# Altium project Palm_V2.2.PrjPcb (part 3 of 3)

## Sheet Motor_Sheet.SchDoc
size B; DocumentNumber: 4; SheetNumber: 4; SheetTotal: 7
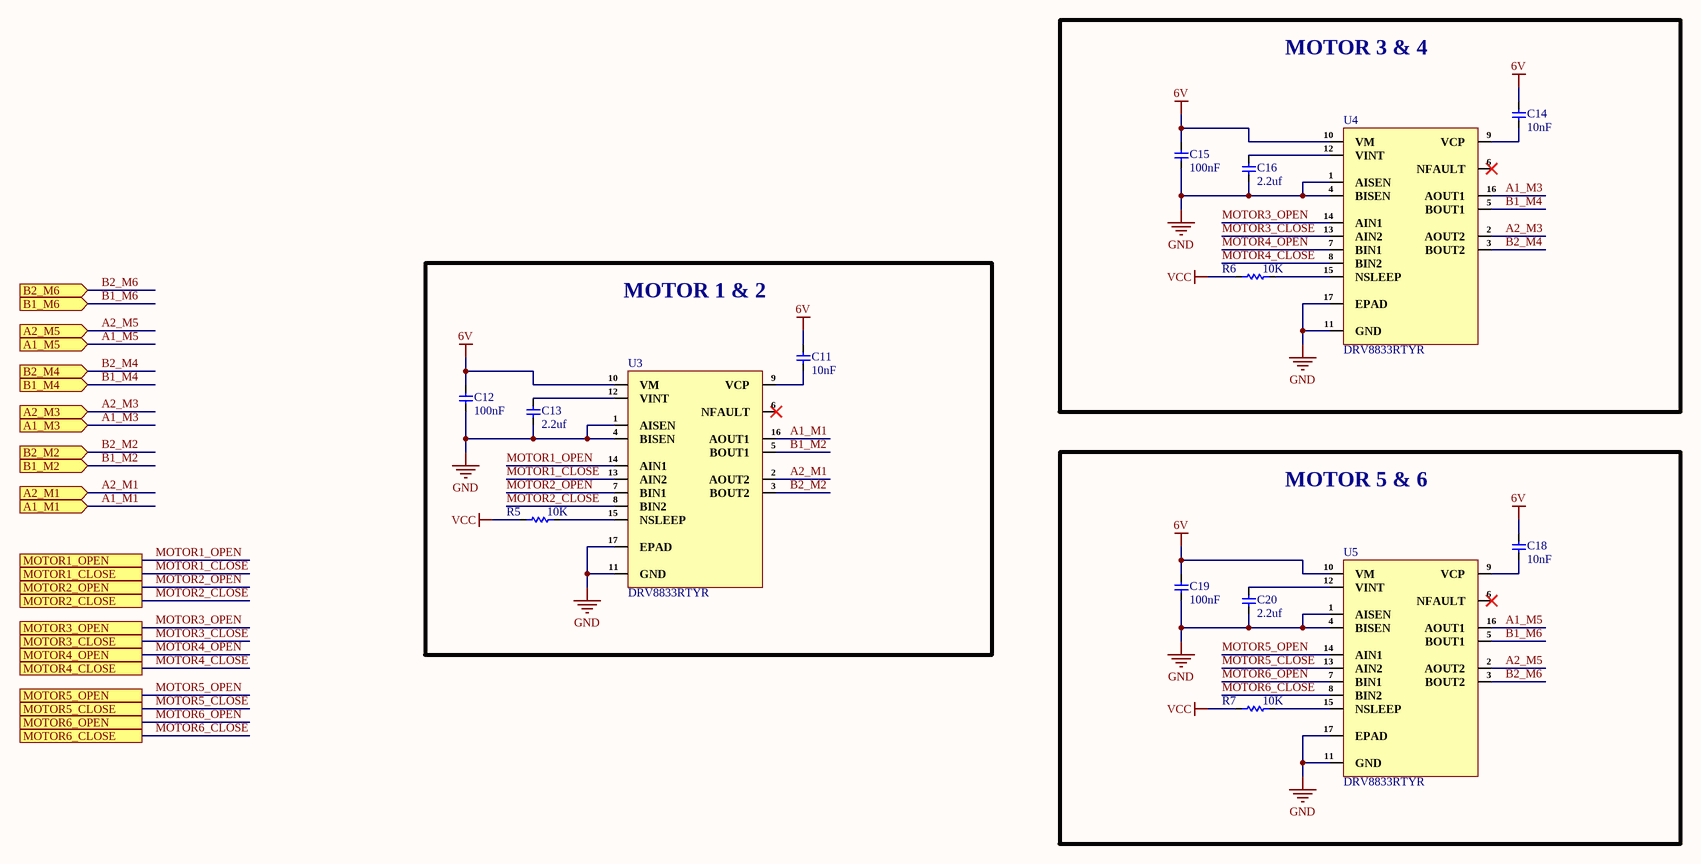
[diagram p5: Motor_Sheet.SchDoc]

### Parts
C11  10nF  [Cap-0402]
C12  100nF  [Cap-0402]
C13  2.2uf  [Cap-0402]
C14  10nF  [Cap-0402]
C15  100nF  [Cap-0402]
C16  2.2uf  [Cap-0402]
C18  10nF  [Cap-0402]
C19  100nF  [Cap-0402]
C20  2.2uf  [Cap-0402]
R5  10K  [Res-0402]
R6  10K  [Res-0402]
R7  10K  [Res-0402]
U3  DRV8833RTYR  [QFN-16-EP(4x4)]
U4  DRV8833RTYR  [QFN-16-EP(4x4)]
U5  DRV8833RTYR  [QFN-16-EP(4x4)]

### Blocks framed on the sheet
MOTOR 3 & 4: C14-C16 R6 U4
MOTOR 1 & 2: C11-C13 R5 U3
MOTOR 5 & 6: C18-C20 R7 U5

### Ports
A1_M1 (in), A1_M3 (in), A1_M5 (in), A2_M1 (in), A2_M3 (in), A2_M5 (in), B1_M2 (in), B1_M4 (in), B1_M6 (in), B2_M2 (in), B2_M4 (in), B2_M6 (in), MOTOR1_CLOSE, MOTOR1_OPEN, MOTOR2_CLOSE, MOTOR2_OPEN, MOTOR3_CLOSE, MOTOR3_OPEN, MOTOR4_CLOSE, MOTOR4_OPEN, MOTOR5_CLOSE, MOTOR5_OPEN, MOTOR6_CLOSE, MOTOR6_OPEN

### Nets
6V: C11.2 C12.2 C14.2 C15.2 C18.2 C19.2 U3.10(VM) U4.10(VM) U5.10(VM)
GND: C12.1 C13.1 C15.1 C16.1 C19.1 C20.1 U3.1(AISEN) U3.4(BISEN) U3.11(GND) U3.17(EPAD) U4.1(AISEN) U4.4(BISEN) U4.11(GND) U4.17(EPAD) U5.1(AISEN) U5.4(BISEN) U5.11(GND) U5.17(EPAD)
VCC: R5.1 R6.1 R7.1
A1_M1: U3.16(AOUT1) ; port A1_M1
A1_M3: U4.16(AOUT1) ; port A1_M3
A1_M5: U5.16(AOUT1) ; port A1_M5
A2_M1: U3.2(AOUT2) ; port A2_M1
A2_M3: U4.2(AOUT2) ; port A2_M3
A2_M5: U5.2(AOUT2) ; port A2_M5
B1_M2: U3.5(BOUT1) ; port B1_M2
B1_M4: U4.5(BOUT1) ; port B1_M4
B1_M6: U5.5(BOUT1) ; port B1_M6
B2_M2: U3.3(BOUT2) ; port B2_M2
B2_M4: U4.3(BOUT2) ; port B2_M4
B2_M6: U5.3(BOUT2) ; port B2_M6
MOTOR1_CLOSE: U3.13(AIN2) ; port MOTOR1_CLOSE
MOTOR1_OPEN: U3.14(AIN1) ; port MOTOR1_OPEN
MOTOR2_CLOSE: U3.8(BIN2) ; port MOTOR2_CLOSE
MOTOR2_OPEN: U3.7(BIN1) ; port MOTOR2_OPEN
MOTOR3_CLOSE: U4.13(AIN2) ; port MOTOR3_CLOSE
MOTOR3_OPEN: U4.14(AIN1) ; port MOTOR3_OPEN
MOTOR4_CLOSE: U4.8(BIN2) ; port MOTOR4_CLOSE
MOTOR4_OPEN: U4.7(BIN1) ; port MOTOR4_OPEN
MOTOR5_CLOSE: U5.13(AIN2) ; port MOTOR5_CLOSE
MOTOR5_OPEN: U5.14(AIN1) ; port MOTOR5_OPEN
MOTOR6_CLOSE: U5.8(BIN2) ; port MOTOR6_CLOSE
MOTOR6_OPEN: U5.7(BIN1) ; port MOTOR6_OPEN
NetC11_1: C11.1 U3.9(VCP)
NetC13_2: C13.2 U3.12(VINT)
NetC14_1: C14.1 U4.9(VCP)
NetC16_2: C16.2 U4.12(VINT)
NetC18_1: C18.1 U5.9(VCP)
NetC20_2: C20.2 U5.12(VINT)
NetR5_2: R5.2 U3.15(NSLEEP)
NetR6_2: R6.2 U4.15(NSLEEP)
NetR7_2: R7.2 U5.15(NSLEEP)

Not connected (* = marked no-connect by the designer): U3 6(NFAULT)*; U4 6(NFAULT)*; U5 6(NFAULT)*

### Library data of the parts
C11 C14 C18 = CC0402KRX7R9BB103: CAP CER 10000PF 50V X7R 0402; Manufacturer: Yageo; Tolerance: 10%; Item Type: Capacitor; Supplier 1: Avnet; Manufacturer Part Number: CC0402KRX7R9BB103; RoHS: Yes; Category: Ceramic Capacitors; Stock 1: 995000; Pricing 1: 10000=0.00178 (USD); Mount: Surface Mount; Case/Package: 0402; Case Code (Imperial): 0402; Case Code (Metric): 1005; Min Operating Temperature: -55°C; Max Operating Temperature: 125°C; Capacitance: 10nF; Dielectric: X7R; Packaging: Tape and Reel; Voltage Rating: 50V; Voltage Rating (DC): 50V; Package Quantity: 1; Termination: SMD/SMT; Resistor Type: Ceramic; Voltage: 50V; Series: CC; Length: 1mm; Width: 0.02inch; Height: 0.5mm; Thickness: 0.022inch; Depth: 0.5mm; Radiation Hardening: No; RoHS Compliant: Yes; Reach SVHC Compliant: Yes; Lead Free: Lead Free; Halogen Free: Halogen Free; ComponentLink1URL: https://datasheet.ciiva.com/11788/0900766b8079c870-11788375.pdf?src-supplier=RSComponents; ComponentLink1Description: https://datasheet.ciiva.com/11788/0900766b8079c870-11788375.pdf?src-supplier=RSComponents; ComponentLink2URL: https://datasheet.ciiva.com/26862/getdatasheetpartid-138248-26862642.pdf?src-supplier=Verical; ComponentLink2Description: https://datasheet.ciiva.com/26862/getdatasheetpartid-138248-26862642.pdf?src-supplier=Verical; ComponentLink3URL: https://datasheet.ciiva.com/7978/1489800-7978093.pdf?src-supplier=Element14; ComponentLink3Description: https://datasheet.ciiva.com/7978/1489800-7978093.pdf?src-supplier=Element14; ComponentLink4URL: https://datasheet.ciiva.com/28450/1489800-28450377.pdf?src-supplier=Element14; ComponentLink4Description: https://datasheet.ciiva.com/28450/1489800-28450377.pdf?src-supplier=Element14; ComponentLink5URL: https://datasheet.ciiva.com/176/mlccorderingcode-176349.pdf?src-supplier=Digi-Key; ComponentLink5Description: https://datasheet.ciiva.com/176/mlccorderingcode-176349.pdf?src-supplier=Digi-Key; ComponentLink6URL: https://datasheet.ciiva.com/176/mlccorderingcode-176348.pdf?src-supplier=Digi-Key; ComponentLink6Description: https://datasheet.ciiva.com/176/mlccorderingcode-176348.pdf?src-supplier=Digi-Key; ComponentLink7URL: https://datasheet.ciiva.com/176/mlccorderingcode-176350.pdf?src-supplier=Digi-Key; ComponentLink7Description: https://datasheet.ciiva.com/176/mlccorderingcode-176350.pdf?src-supplier=Digi-Key; Supplier Part Number 1: CC0402KRX7R9BB103; LCSC Part Number: C60133
C12 C15 C19 = CC0402KRX5R8BB104: CAP CER 0.1UF 25V X5R 0402; Manufacturer: Yageo; Tolerance: 10%; Item Type: Capacitor; Supplier 1: Digi-Key; Manufacturer Part Number: CC0402KRX5R8BB104; RoHS: Yes; Category: Ceramic Capacitors; Stock 1: 4598218; Pricing 1: 1=0.10000, 10=0.03800, 50=0.02100, 100=0.01710, 500=0.01224, 1000=0.00961, 2500=0.00874, 5000=0.00804 (USD); Mount: Surface Mount; Case/Package: 0402; Case Code (Metric): 1005; Case Code (Imperial): 0402; Min Operating Temperature: -55°C; Max Operating Temperature: 85°C; Voltage Rating: 25V; Packaging: Tape and Reel; Capacitance: 100nF; Voltage Rating (DC): 25V; Dielectric: X5R; Resistor Type: Ceramic; Series: CC; Length: 0.039inch; Width: 0.02inch; Thickness: 0.022inch; Depth: 0.5mm; Lead Free: Lead Free; Halogen Free: Halogen Free; RoHS Compliant: Yes; ComponentLink1URL: http://www.mouser.com/ds/2/447/UPY-GPHC_X5R_4V-to-50V_25-1131599.pdf?src-supplier=Mouser; ComponentLink1Description: http://www.mouser.com/ds/2/447/UPY-GPHC_X5R_4V-to-50V_25-1131599.pdf?src-supplier=Mouser; ComponentLink2URL: http://www.yageo.com/documents/recent/UPY-GPHC_X5R_4V-to-50V-16.pdf?src-supplier=Future+Electronics; ComponentLink2Description: http://www.yageo.com/documents/recent/UPY-GPHC_X5R_4V-to-50V-16.pdf?src-supplier=Future+Electronics; ComponentLink3URL: http://www.yageo.com/documents/recent/UPY-GPHC_X5R_4V-to-50V_25.pdf?src-supplier=Digi-Key; ComponentLink3Description: http://www.yageo.com/documents/recent/UPY-GPHC_X5R_4V-to-50V_25.pdf?src-supplier=Digi-Key; Supplier Part Number 1: 311-1697-1-ND; LCSC Part Number: C106256
C13 C16 C20 = GRM155R61E225KE11D: CAP CER 2.2UF 25V X5R 0402; Manufacturer: Murata; Material: Ceramic; Tolerance: 10%; Item Type: Capacitor; Supplier 1: Avnet; Manufacturer Part Number: GRM155R61E225KE11D; RoHS: Yes; Category: Ceramic Capacitors; Stock 1: 210000; Pricing 1: 10000=0.03830, 20000=0.03623, 40000=0.03416, 60000=0.03209, 80000=0.03002, 100000=0.02795, 1000000=0.02588 (USD); Mount: Surface Mount; Case/Package: 0402; Case Code (Metric): 1005; Case Code (Imperial): 0402; Weight: 0.000212oz; Min Operating Temperature: -55°C; Max Operating Temperature: 85°C; Dielectric: X5R; Capacitance: 2.2uF; Packaging: Tape and Reel; Voltage Rating: 25V; Termination: SMD/SMT; Resistor Type: Ceramic; Voltage Rating (DC): 25V; Package Quantity: 10000; Length: 1mm; Width: 0.5mm; Height: 0.5mm; Thickness: 0.022inch; Lead Free: Lead Free; RoHS Compliant: Yes; ComponentLink1URL: http://www.mouser.com/ds/2/281/c02e-2905.pdf?src-supplier=Mouser; ComponentLink1Description: http://www.mouser.com/ds/2/281/c02e-2905.pdf?src-supplier=Mouser; ComponentLink2URL: http://search.murata.co.jp/Ceramy/image/img/A01X/G101/ENG/GRM155R61E225KE11-01.pdf?src-supplier=Digi-Key; ComponentLink2Description: http://search.murata.co.jp/Ceramy/image/img/A01X/G101/ENG/GRM155R61E225KE11-01.pdf?src-supplier=Digi-Key; ComponentLink3URL: http://search.murata.co.jp/Ceramy/image/img/A01X/partnumbering_e_01.pdf?src-supplier=Digi-Key; ComponentLink3Description: http://search.murata.co.jp/Ceramy/image/img/A01X/partnumbering_e_01.pdf?src-supplier=Digi-Key; ComponentLink4URL: http://psearch.en.murata.com/capacitor/product/GRM155R61E225KE11%23.pdf?src-supplier=Avnet; ComponentLink4Description: http://psearch.en.murata.com/capacitor/product/GRM155R61E225KE11%23.pdf?src-supplier=Avnet; Supplier Part Number 1: GRM155R61E225KE11D; LCSC Part Number: C385032
R5-R7 = RC0402FR-0710KL: RES 10K OHM 1% 1/16W 0402; Manufacturer: Yageo; Resistance: 10kR; Voltage Rating (DC): 50V; Temperature Coefficient: 100ppm/°C; Power Rating: 62.5mW; Max Power Dissipation: 63mW; Item Type: Resistor; Supplier 1: Mouser; Manufacturer Part Number: RC0402FR-0710KL; RoHS: Yes; Category: Chip SMD Resistors; Stock 1: 18648329; Pricing 1: 1=0.10000, 10=0.01400, 50=0.01400, 100=0.00500, 1000=0.00300, 10000=0.00200 (USD); Case/Package: 0402; Number of Pins: 2; Case Code (Imperial): 0402; Case Code (Metric): 1005; Min Operating Temperature: -55°C; Max Operating Temperature: 155°C; Resistor Type: Thick Film; Tolerance: 1%; Packaging: Tape and Reel; Voltage Rating: 50V; Termination: SMD/SMT; Working Voltage: 50V; Number of Terminations: 2; Features: Moisture Resistant; Series: RC; Resistance Tolerance: 1%; Construction: Rectangular; Length: 1mm; Width: 0.5mm; Height: 0.32mm; Depth: 0.5mm; Lead Pitch: 0.2mm; REACH SVHC: No SVHC; Lead Free: Lead Free; RoHS Compliant: Yes; Military Standard: Not; ComponentLink1URL: https://datasheet.ciiva.com/7660/38568-7660787.pdf?src-supplier=Element14; ComponentLink1Description: https://datasheet.ciiva.com/7660/38568-7660787.pdf?src-supplier=Element14; ComponentLink2URL: https://datasheet.ciiva.com/7849/1686128-7849814.pdf?src-supplier=Element14; ComponentLink2Description: https://datasheet.ciiva.com/7849/1686128-7849814.pdf?src-supplier=Element14; ComponentLink3URL: https://datasheet.ciiva.com/7983/1018594-7983486.pdf?src-supplier=Element14; ComponentLink3Description: https://datasheet.ciiva.com/7983/1018594-7983486.pdf?src-supplier=Element14; ComponentLink4URL: https://datasheet.ciiva.com/22747/1018594-22747512.pdf?src-supplier=Element14; ComponentLink4Description: https://datasheet.ciiva.com/22747/1018594-22747512.pdf?src-supplier=Element14; ComponentLink5URL: https://datasheet.ciiva.com/12667/pyu-rc0402-51-rohs-l-6-r-12667067.pdf?src-supplier=Mouser; ComponentLink5Description: https://datasheet.ciiva.com/12667/pyu-rc0402-51-rohs-l-6-r-12667067.pdf?src-supplier=Mouser; ComponentLink6URL: https://datasheet.ciiva.com/7849/1784430-7849813.pdf?src-supplier=Element14; ComponentLink6Description: https://datasheet.ciiva.com/7849/1784430-7849813.pdf?src-supplier=Element14; ComponentLink7URL: https://datasheet.ciiva.com/7849/1784430-7849815.pdf?src-supplier=Element14; ComponentLink7Description: https://datasheet.ciiva.com/7849/1784430-7849815.pdf?src-supplier=Element14; Supplier Part Number 1: 603-RC0402FR-0710KL; LCSC Part Number: C60490
U3-U5 = DRV8833RTYR: IC MOTOR DRIVER PAR 16QFN; Manufacturer: Texas Instruments; Supplier: Mouser; Supplier Part Number: 595-DRV8833RTYR; Manufacturer Part Number: DRV8833RTYR; RoHS: Yes; Item Type: IC; Stock: 2803; Pricing: 1=1.6, 10=1.36, 50=1.36, 100=1.16, 1000=0.954, 10000=0.875 (USD); ComponentLink1URL: https://datasheet.ciiva.com/15109/getdatasheetpartid-567030-15109665.pdf?src-supplier=Verical; ComponentLink1Description: https://datasheet.ciiva.com/15109/getdatasheetpartid-567030-15109665.pdf?src-supplier=Verical; ComponentLink2URL: https://datasheet.ciiva.com/3229/drv8833-3229034.pdf?src-supplier=Avnet; ComponentLink2Description: https://datasheet.ciiva.com/3229/drv8833-3229034.pdf?src-supplier=Avnet; ComponentLink3URL: https://datasheet.ciiva.com/1959/drv8833-1959716.pdf?src-supplier=Digikey; ComponentLink3Description: https://datasheet.ciiva.com/1959/drv8833-1959716.pdf?src-supplier=Digikey; ComponentLink4URL: https://datasheet.ciiva.com/1959/drv8833-1959717.pdf?src-supplier=Digikey; ComponentLink4Description: https://datasheet.ciiva.com/1959/drv8833-1959717.pdf?src-supplier=Digikey; ComponentLink5URL: https://datasheet.ciiva.com/1959/drv8833-1959718.pdf?src-supplier=Digikey; ComponentLink5Description: https://datasheet.ciiva.com/1959/drv8833-1959718.pdf?src-supplier=Digikey; LCSC Part Number: C154936

## Sheet USB-to-UART_Sheet.SchDoc
size A; DocumentNumber: 7; SheetNumber: 6; SheetTotal: 7
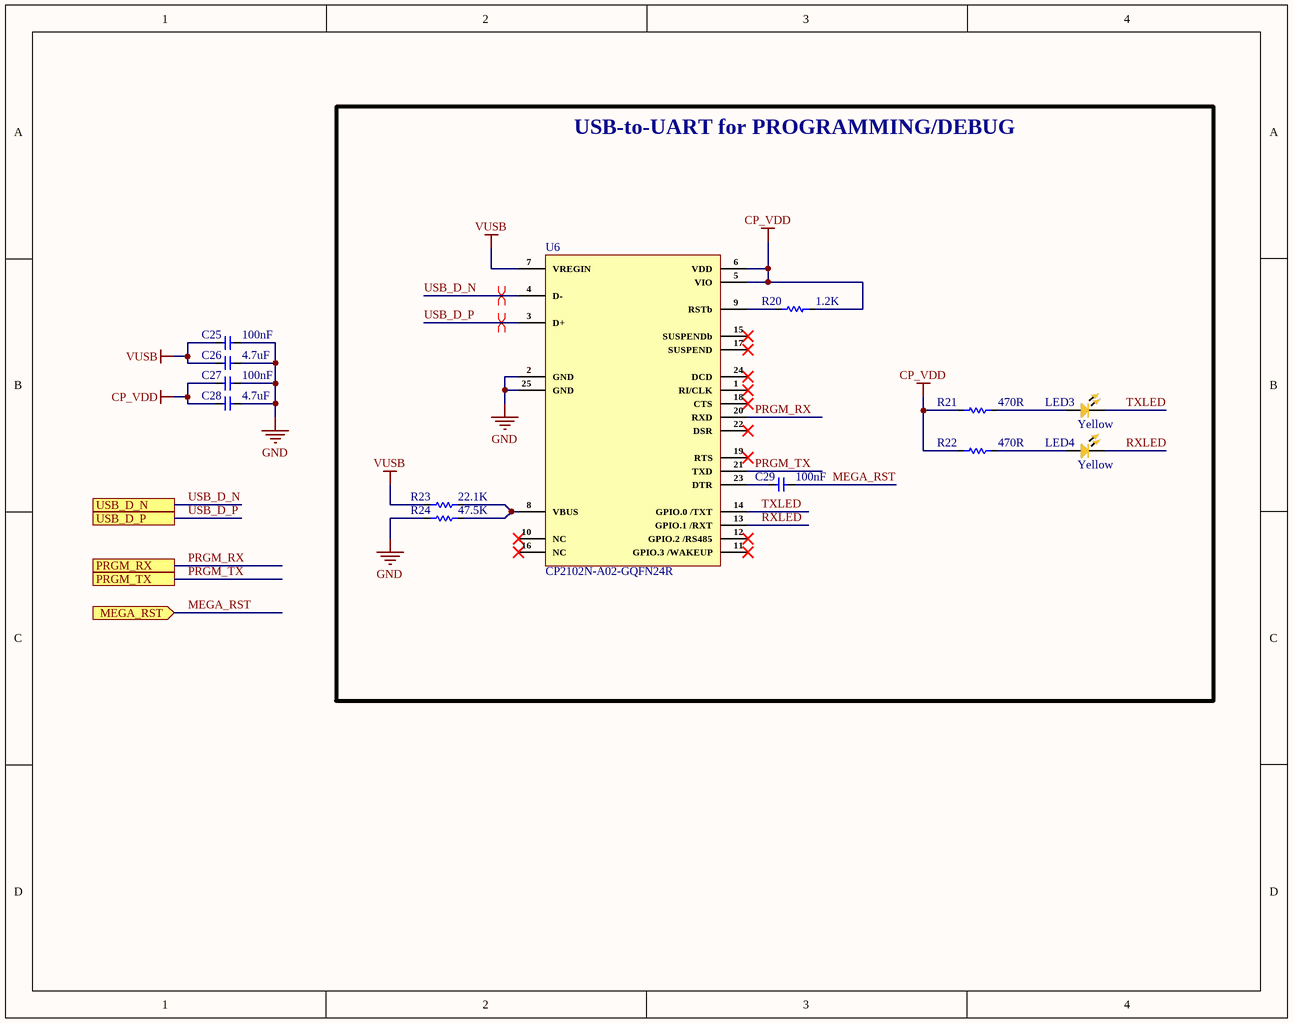
[diagram p6: USB-to-UART_Sheet.SchDoc]

### Parts
C25  100nF  [Cap-0402]
C26  4.7uF  [Cap-0402]
C27  100nF  [Cap-0402]
C28  4.7uF  [Cap-0402]
C29  100nF  [Cap-0402]
LED3  Yellow  [LED-0603]
LED4  Yellow  [LED-0603]
R20  1.2K  [Res-0402]
R21  470R  [Res-0402]
R22  470R  [Res-0402]
R23  22.1K  [Res-0402]
R24  47.5K  [Res-0402]
U6  CP2102N-A02-GQFN24R  [24-QFN (4x4)]

### Blocks framed on the sheet
USB-to-UART for PROGRAMMING/DEBUG: C29 LED3 LED4 R20-R24 U6

### Ports
MEGA_RST (in), PRGM_RX, PRGM_TX, USB_D_N, USB_D_P

### Nets
CP_VDD: C27.1 C28.1 R20.2 R21.1 R22.1 U6.5(VIO) U6.6(VDD)
GND: C25.2 C26.2 C27.2 C28.2 R24.1 U6.2(GND) U6.25(GND)
VUSB: C25.1 C26.1 R23.1 U6.7(VREGIN)
MEGA_RST: C29.2 ; port MEGA_RST
PRGM_RX: U6.20(RXD) ; port PRGM_RX
PRGM_TX: U6.21(TXD) ; port PRGM_TX
RXLED: LED4.2 U6.13(GPIO.1_/RXT)
TXLED: LED3.2 U6.14(GPIO.0_/TXT)
USB_D_N: U6.4(D-) ; port USB_D_N
USB_D_P: U6.3(D+) ; port USB_D_P
NetC29_1: C29.1 U6.23(DTR)
NetLED3_1: LED3.1 R21.2
NetLED4_1: LED4.1 R22.2
NetR20_1: R20.1 U6.9(RSTb)
NetR23_2: R23.2 R24.2 U6.8(VBUS)

Not connected (* = marked no-connect by the designer): U6 1(RI/CLK)* 10(NC)* 11(GPIO.3_/WAKEUP)* 12(GPIO.2_/RS485)* 15(SUSPENDb)* 16(NC)* 17(SUSPEND)* 18(CTS)* 19(RTS)* 22(DSR)* 24(DCD)*

### Layout directives
differential pair; net class USB; differential pair class USB_Lines; rule Impedance Constraint [Min = 85.00    Max = 90.00    ]; rule Matched Net Lengths [Tolerance = 50mil]: USB_D_N, USB_D_P
differential pair; net class HDMI_TX2; differential pair class HDMI_Lines; rule Impedance Constraint [Min = 85.00    Max = 90.00    ]; rule Matched Net Lengths [Tolerance = 50mil]: USB_D_N

### Notes on the sheet
- File:
- Title:
- Date:
- Page
- Num:
- Total:
- Drawn By: Huzaifa Ali

### Library data of the parts
C25 C27 C29 = CC0402KRX5R8BB104: as C12 on sheet Motor_Sheet; Supplier 1: Digi-Key; Manufacturer Part Number: CC0402KRX5R8BB104; RoHS: Yes; Category: Ceramic Capacitors; Stock 1: 4598218; Pricing 1: 1=0.10000, 10=0.03800, 50=0.02100, 100=0.01710, 500=0.01224, 1000=0.00961, 2500=0.00874, 5000=0.00804 (USD); Mount: Surface Mount; Case/Package: 0402; Case Code (Metric): 1005; Case Code (Imperial): 0402; Min Operating Temperature: -55°C; Max Operating Temperature: 85°C; Voltage Rating: 25V; Packaging: Tape and Reel; Capacitance: 100nF; Voltage Rating (DC): 25V; Dielectric: X5R; Resistor Type: Ceramic; Series: CC; Length: 0.039inch; Width: 0.02inch; Thickness: 0.022inch; Depth: 0.5mm; Lead Free: Lead Free; Halogen Free: Halogen Free; RoHS Compliant: Yes; ComponentLink1URL: http://www.mouser.com/ds/2/447/UPY-GPHC_X5R_4V-to-50V_25-1131599.pdf?src-supplier=Mouser; ComponentLink1Description: http://www.mouser.com/ds/2/447/UPY-GPHC_X5R_4V-to-50V_25-1131599.pdf?src-supplier=Mouser; ComponentLink2URL: http://www.yageo.com/documents/recent/UPY-GPHC_X5R_4V-to-50V-16.pdf?src-supplier=Future+Electronics; ComponentLink2Description: http://www.yageo.com/documents/recent/UPY-GPHC_X5R_4V-to-50V-16.pdf?src-supplier=Future+Electronics; ComponentLink3URL: http://www.yageo.com/documents/recent/UPY-GPHC_X5R_4V-to-50V_25.pdf?src-supplier=Digi-Key; ComponentLink3Description: http://www.yageo.com/documents/recent/UPY-GPHC_X5R_4V-to-50V_25.pdf?src-supplier=Digi-Key; Supplier Part Number 1: 311-1697-1-ND; LCSC Part Number: C106256
C26 C28 = CC0402KRX5R6BB475: CAP CER 4.7UF 10V X5R 0402; Manufacturer: Yageo; Tolerance: 10%; Supplier 1: Farnell; Manufacturer Part Number: CC0402KRX5R6BB475; RoHS: Yes; Category: Ceramic Capacitors; Stock 1: 20000; Pricing 1: 10000=0.02310, 50000=0.02100 (GBP); Mount: Surface Mount; Case/Package: 0402; Case Code (Imperial): 0402; Case Code (Metric): 1005; Min Operating Temperature: -55°C; Max Operating Temperature: 85°C; Packaging: Cut Tape; Capacitance: 4.7uF; Voltage Rating: 10V; RoHS Compliant: Yes; ComponentLink1URL: http://www.yageo.com/documents/recent/UPY-GPHC_X5R_4V-to-50V_25.pdf?src-supplier=Digi-Key; ComponentLink1Description: http://www.yageo.com/documents/recent/UPY-GPHC_X5R_4V-to-50V_25.pdf?src-supplier=Digi-Key; Supplier Part Number 1: 3871698; LCSC Part Number: C326586
LED3 LED4 = NCD0603Y2: yellow 0603 Light Emitting Diodes (LED) ROHS; Manufacturer: Foshan NationStar Optoelectronics; Manufacturer Part Number: NCD0603Y2; Package: 0603; LCSC Part Number: C89811; Item Type: LED; ComponentLink1Description: LCSC; ComponentLink1URL: https://www.lcsc.com/product-detail/Light-Emitting-Diodes-LED_Foshan-NationStar-Optoelectronics-NCD0603Y2_C89811.html
R20 = RC0402FR-071K2L: RES 1.2K OHM 1% 1/16W 0402; Manufacturer: Yageo; Resistance: 1.2kR; Power Rating: 63mW; Voltage Rating: 50V; Temperature Coefficient: 100ppm/°C; Item Type: Resistor; Supplier 1: Avnet; Manufacturer Part Number: RC0402FR-071K2L; RoHS: Yes; Category: Chip SMD Resistors; Stock 1: 170000; Pricing 1: 10000=0.00085 (USD); Case/Package: 0402; Case Code (Imperial): 0402; Case Code (Metric): 1005; Size Code: 0402; Min Operating Temperature: -55°C; Max Operating Temperature: 155°C; Tolerance: 1%; Packaging: Tape and Reel; Package Quantity: 1; Termination: SMD/SMT; Resistor Type: Thick Film; Number of Terminations: 2; Max Power Dissipation: 63mW; Features: Moisture Resistant; Series: RC; Construction: Rectangular; Resistance Tolerance: 1%; Technology: THICK FILM; Length: 0.039inch; Width: 0.02inch; Height: 0.016inch; Depth: 0.5mm; Military Standard: Not; Lead Free: Lead Free; RoHS Compliant: Yes; ComponentLink1URL: https://datasheet.ciiva.com/11808/0900766b80c66297-11808455.pdf?src-supplier=RSComponents; ComponentLink1Description: https://datasheet.ciiva.com/11808/0900766b80c66297-11808455.pdf?src-supplier=RSComponents; ComponentLink2URL: https://datasheet.ciiva.com/2453/pyu-r-int-thick-7-2453467.pdf?src-supplier=Digi-Key; ComponentLink2Description: https://datasheet.ciiva.com/2453/pyu-r-int-thick-7-2453467.pdf?src-supplier=Digi-Key; ComponentLink3URL: https://datasheet.ciiva.com/2453/pyu-r-int-thick-7-2453468.pdf?src-supplier=Digi-Key; ComponentLink3Description: https://datasheet.ciiva.com/2453/pyu-r-int-thick-7-2453468.pdf?src-supplier=Digi-Key; ComponentLink4URL: https://datasheet.ciiva.com/2453/pyu-r-int-thick-7-2453466.pdf?src-supplier=Digi-Key; ComponentLink4Description: https://datasheet.ciiva.com/2453/pyu-r-int-thick-7-2453466.pdf?src-supplier=Digi-Key; ComponentLink5URL: https://datasheet.ciiva.com/7849/1018594-7849861.pdf?src-supplier=Element14; ComponentLink5Description: https://datasheet.ciiva.com/7849/1018594-7849861.pdf?src-supplier=Element14; ComponentLink6URL: https://datasheet.ciiva.com/7849/1018594-7849862.pdf?src-supplier=Element14; ComponentLink6Description: https://datasheet.ciiva.com/7849/1018594-7849862.pdf?src-supplier=Element14; ComponentLink7URL: https://datasheet.ciiva.com/15189/getdatasheetpartid-323716-15189366.pdf?src-supplier=Verical; ComponentLink7Description: https://datasheet.ciiva.com/15189/getdatasheetpartid-323716-15189366.pdf?src-supplier=Verical; ComponentLink8URL: https://datasheet.ciiva.com/16745/pyu-rc0402-51-rohs-l-6-r-16745005.pdf?src-supplier=Future+Electronics; ComponentLink8Description: https://datasheet.ciiva.com/16745/pyu-rc0402-51-rohs-l-6-r-16745005.pdf?src-supplier=Future+Electronics; Supplier Part Number 1: RC0402FR-071K2L; LCSC Part Number: C138040
R21 R22 = RC0402FR-07470RL: RES 470 OHM 1% 1/16W 0402; Manufacturer: Yageo; Item Type: Resistor; Voltage Rating: 50V; Power Rating: 62.5mW; Temperature Coefficient: 100ppm/°C; Max Power Dissipation: 63mW; Supplier: Avnet; Supplier Part Number: RC0402FR-07470RL; Manufacturer Part Number: RC0402FR-07470RL; RoHS: Yes; Stock: 10000; Pricing: 10000=0.00085 (USD); Case/Package: 0402; Case Code (Metric): 1005; Case Code (Imperial): 0402; Min Operating Temperature: -55°C; Max Operating Temperature: 155°C; Packaging: Tape and Reel; Value: 470R; Tolerance: 1%; Number of Terminations: 2; Working Voltage: 50V; Package Quantity: 1; Resistor Type: Thick Film; Termination: SMD/SMT; Features: Moisture Resistant; Series: RC; Resistance Tolerance: 1%; Construction: Rectangular; Voltage Rating (AC): 50V; Length: 1mm; Width: 0.02inch; Height: 0.016inch; Depth: 0.5mm; Lead Free: Lead Free; Reach SVHC Compliant: No; RoHS Compliant: Yes; Military Standard: Not; ComponentLink1URL: https://datasheet.ciiva.com/46412/1018594-46412838.pdf?src-supplier=Element14; ComponentLink1Description: https://datasheet.ciiva.com/46412/1018594-46412838.pdf?src-supplier=Element14; ComponentLink2URL: https://datasheet.ciiva.com/2453/pyu-r-int-thick-7-2453377.pdf?src-supplier=Digikey; ComponentLink2Description: https://datasheet.ciiva.com/2453/pyu-r-int-thick-7-2453377.pdf?src-supplier=Digikey; ComponentLink3URL: https://datasheet.ciiva.com/2453/pyu-r-int-thick-7-2453378.pdf?src-supplier=Digikey; ComponentLink3Description: https://datasheet.ciiva.com/2453/pyu-r-int-thick-7-2453378.pdf?src-supplier=Digikey; ComponentLink4URL: https://datasheet.ciiva.com/2453/pyu-r-int-thick-7-2453376.pdf?src-supplier=Digikey; ComponentLink4Description: https://datasheet.ciiva.com/2453/pyu-r-int-thick-7-2453376.pdf?src-supplier=Digikey; ComponentLink5URL: https://datasheet.ciiva.com/7850/1018594-7850015.pdf?src-supplier=Element14; ComponentLink5Description: https://datasheet.ciiva.com/7850/1018594-7850015.pdf?src-supplier=Element14; ComponentLink6URL: https://datasheet.ciiva.com/7850/1018594-7850014.pdf?src-supplier=Element14; ComponentLink6Description: https://datasheet.ciiva.com/7850/1018594-7850014.pdf?src-supplier=Element14; ComponentLink7URL: https://datasheet.ciiva.com/15189/getdatasheetpartid-330246-15189463.pdf?src-supplier=Verical; ComponentLink7Description: https://datasheet.ciiva.com/15189/getdatasheetpartid-330246-15189463.pdf?src-supplier=Verical; LCSC Part Number: C114877
R23 = RT0402BRD0722K1L: RES SMD 22.1KOHM 0.1% 1/16W 0402; Manufacturer: Yageo; Value: 22.1kR; Power Rating: 62.5mW; Voltage Rating: 50V; Max Power Dissipation: 63mW; Temperature Coefficient: 25ppm/°C; Item Type: Resistor; Supplier 1: Arrow Electronics; Manufacturer Part Number: RT0402BRD0722K1L; RoHS: Yes; Category: Chip SMD Resistors; Stock 1: 40000; Pricing 1: 10000=0.0417, 20000=0.0733, 30000=0.041, 40000=0.0719, 50000=0.0402, 100000=0.0393 (USD); Case/Package: 0402; Case Code (Metric): 1005; Case Code (Imperial): 0402; Weight: 2.3E-05oz; Min Operating Temperature: -55°C; Max Operating Temperature: 155°C; Tolerance: 0.1%; Packaging: Tape and Reel; Package Quantity: 10000; Number of Terminations: 2; Termination: SMD/SMT; Voltage Rating (DC): 50V; Series: RT; Length: 0.039inch; Width: 0.5mm; Height: 0.014inch; Lead Free: Lead Free; RoHS Compliant: Yes; ComponentLink1URL: https://datasheet.ciiva.com/2582/pyu-rt-1-to-0-05-rohs-l-5-2582235.pdf?src-supplier=Digi-Key; ComponentLink1Description: https://datasheet.ciiva.com/2582/pyu-rt-1-to-0-05-rohs-l-5-2582235.pdf?src-supplier=Digi-Key; ComponentLink2URL: https://datasheet.ciiva.com/12797/pyu-rt-1-to-0-05-rohs-l-4-12797086.pdf?src-supplier=Mouser; ComponentLink2Description: https://datasheet.ciiva.com/12797/pyu-rt-1-to-0-05-rohs-l-4-12797086.pdf?src-supplier=Mouser; Supplier Part Number 1: RT0402BRD0722K1L; LCSC Part Number: C852648
R24 = 0402WGF4752TCE: 62.5mW Thick Film Resistors 50V ±100ppm/℃ ±1% 47.5kΩ 0402 Chip Resistor - Surface Mount ROHS; Manufacturer: Uniroyal; Supplier: LCSC; LCSC Part Number: C25896; Manufacturer Part Number: 0402WGF4752TCE; RoHS: No; Item Type: Resistor
U6 = CP2102N-A02-GQFN24R: IC USB TO UART BRIDGE QFN24; Manufacturer: Silicon Labs; Supplier 1: Arrow Electronics; Manufacturer Part Number: CP2102N-A02-GQFN24R; RoHS: Yes; Category: Interface ICs; Stock 1: 321; Pricing 1: 1=2.66900, 10=2.64300, 25=2.61700, 100=2.59000, 250=2.56400 (USD); ComponentLink1URL: https://www.silabs.com/documents/public/data-sheets/cp2102n-datasheet.pdf?src-supplier=Digi-Key; ComponentLink1Description: https://www.silabs.com/documents/public/data-sheets/cp2102n-datasheet.pdf?src-supplier=Digi-Key; Supplier Part Number 1: CP2102N-A02-GQFN24R; LCSC Part Number: C969151; Item Type: IC

## Nets that join several sheets
6V: Power_Sheet (17 pins), Motor_Sheet (9 pins)
GND: Power_Sheet (29 pins), Connector_Sheet (12 pins), Motor_Connector_Sheet (6 pins), Controller_Sheet (19 pins), Motor_Sheet (18 pins), USB-to-UART_Sheet (7 pins)
VCC: Power_Sheet (D2.2 D3.2), Connector_Sheet (J19.1 J20.1), Motor_Connector_Sheet (7 pins), Controller_Sheet (16 pins), Motor_Sheet (R5.1 R6.1 R7.1)
VUSB: Power_Sheet (D2.1), Connector_Sheet (5 pins), USB-to-UART_Sheet (C25.1 C26.1 R23.1 U6.7)
A1_M1: Motor_Connector_Sheet (J5.3), Motor_Sheet (U3.16)
A1_M3: Motor_Connector_Sheet (J7.3), Motor_Sheet (U4.16)
A1_M5: Motor_Connector_Sheet (J9.3), Motor_Sheet (U5.16)
A2_M1: Motor_Connector_Sheet (J5.4), Motor_Sheet (U3.2)
A2_M3: Motor_Connector_Sheet (J7.4), Motor_Sheet (U4.2)
A2_M5: Motor_Connector_Sheet (J9.4), Motor_Sheet (U5.2)
B1_M2: Motor_Connector_Sheet (J6.3), Motor_Sheet (U3.5)
B1_M4: Motor_Connector_Sheet (J8.3), Motor_Sheet (U4.5)
B1_M6: Motor_Connector_Sheet (J10.3), Motor_Sheet (U5.5)
B2_M2: Motor_Connector_Sheet (J6.4), Motor_Sheet (U3.3)
B2_M4: Motor_Connector_Sheet (J8.4), Motor_Sheet (U4.3)
B2_M6: Motor_Connector_Sheet (J10.4), Motor_Sheet (U5.3)
MEGA_RST: Connector_Sheet (C24.2), Controller_Sheet (J1.5 R1.2 U2.30), USB-to-UART_Sheet (C29.2)
MOTOR1_CLOSE: Controller_Sheet (U2.6), Motor_Sheet (U3.13)
MOTOR1_OPEN: Controller_Sheet (U2.5), Motor_Sheet (U3.14)
MOTOR1_SENSE: Motor_Connector_Sheet (J5.1), Controller_Sheet (U2.97)
MOTOR2_CLOSE: Controller_Sheet (U2.15), Motor_Sheet (U3.8)
MOTOR2_OPEN: Controller_Sheet (U2.7), Motor_Sheet (U3.7)
MOTOR2_SENSE: Motor_Connector_Sheet (J6.1), Controller_Sheet (U2.96)
MOTOR3_CLOSE: Controller_Sheet (U2.17), Motor_Sheet (U4.13)
MOTOR3_OPEN: Controller_Sheet (U2.16), Motor_Sheet (U4.14)
MOTOR3_SENSE: Motor_Connector_Sheet (J7.1), Controller_Sheet (U2.95)
MOTOR4_CLOSE: Controller_Sheet (U2.23), Motor_Sheet (U4.8)
MOTOR4_OPEN: Controller_Sheet (U2.18), Motor_Sheet (U4.7)
MOTOR4_SENSE: Motor_Connector_Sheet (J8.1), Controller_Sheet (U2.94)
MOTOR5_CLOSE: Controller_Sheet (U2.25), Motor_Sheet (U5.13)
MOTOR5_OPEN: Controller_Sheet (U2.24), Motor_Sheet (U5.14)
MOTOR5_SENSE: Motor_Connector_Sheet (J9.1), Controller_Sheet (U2.93)
MOTOR6_CLOSE: Controller_Sheet (U2.1), Motor_Sheet (U5.8)
MOTOR6_OPEN: Controller_Sheet (U2.26), Motor_Sheet (U5.7)
MOTOR6_SENSE: Motor_Connector_Sheet (J10.1 J23.1 R16.1), Controller_Sheet (U2.92)
MUSCLE_SENSE1: Connector_Sheet (R13.1), Controller_Sheet (U2.91)
MUSCLE_SENSE2: Connector_Sheet (R11.1), Controller_Sheet (U2.90)
PRGM_RX: Connector_Sheet (R18.1), Controller_Sheet (U2.3), USB-to-UART_Sheet (U6.20)
PRGM_TX: Connector_Sheet (R19.1), Controller_Sheet (U2.2), USB-to-UART_Sheet (U6.21)
RXD3: Connector_Sheet (R15.1), Controller_Sheet (U2.63)
SCL: Connector_Sheet (R14.1), Controller_Sheet (U2.43)
SDA: Connector_Sheet (R12.1), Controller_Sheet (U2.44)
TXD3: Connector_Sheet (R10.1), Controller_Sheet (U2.64)
USB_D_N: Connector_Sheet (D4.2 J4.A7 J4.B7), USB-to-UART_Sheet (U6.4)
USB_D_P: Connector_Sheet (D4.1 J4.A6 J4.B6), USB-to-UART_Sheet (U6.3)